# Altium project NanoD1.PrjPcb (part 2 of 2)
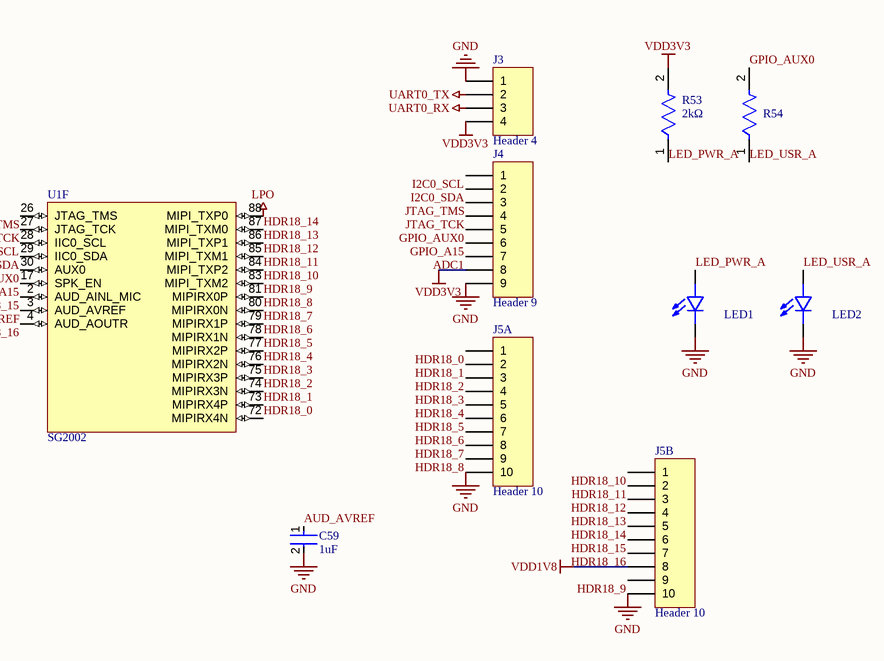
[diagram p8: NanoD1_IO.SchDoc]

## Nets that join several sheets
GND: NanoD1_Power (26 pins), NanoD1_Decoupling (28 pins), NanoD1_Storage (13 pins), NanoD1_USB (14 pins), NanoD1_Audio (13 pins), NanoD1_Wireless (13 pins), NanoD1_Clk_Reset (7 pins), NanoD1_IO (7 pins)
LPO: NanoD1_Wireless (U4.24), NanoD1_IO (U1.88)
UART0_RX: NanoD1_Storage (R12.2 U1.19), NanoD1_IO (J3.3)
UART0_TX: NanoD1_Storage (R11.2 U1.18), NanoD1_IO (J3.2)
VBUS_5V: NanoD1_Power (11 pins), NanoD1_USB (8 pins)
VDD1V8: NanoD1_Power (8 pins), NanoD1_Decoupling (8 pins), NanoD1_Audio (C62.2 R60.2 U10.7), NanoD1_Clk_Reset (R15.2 R52.1), NanoD1_IO (J5B.8)
VDD1V35: NanoD1_Power (8 pins), NanoD1_Decoupling (6 pins)
VDD3V3: NanoD1_Power (9 pins), NanoD1_Decoupling (C33.1 C34.1 C35.2 C36.2), NanoD1_Storage (12 pins), NanoD1_Audio (C60.1 C61.2 U9.7 U9.8), NanoD1_Wireless (7 pins), NanoD1_IO (J3.4 J4.8 R53.2)
VDDC: NanoD1_Power (9 pins), NanoD1_Decoupling (10 pins)
ADC1: NanoD1_Clk_Reset (U1.59), NanoD1_IO (J4.7)

## Assembly variants
Assembly: not fitted R13 R14 R56 R58 R59